# Altium schematic sheet DXES101B-659637-MODEM-PORT.SchDoc
size A3; Organization: Altium Limited; Address1: 3 Minna Close; Address2: Belrose; Address3: NSW 2085; Address4: Australia; SheetNumber: 10; SheetTotal: 10
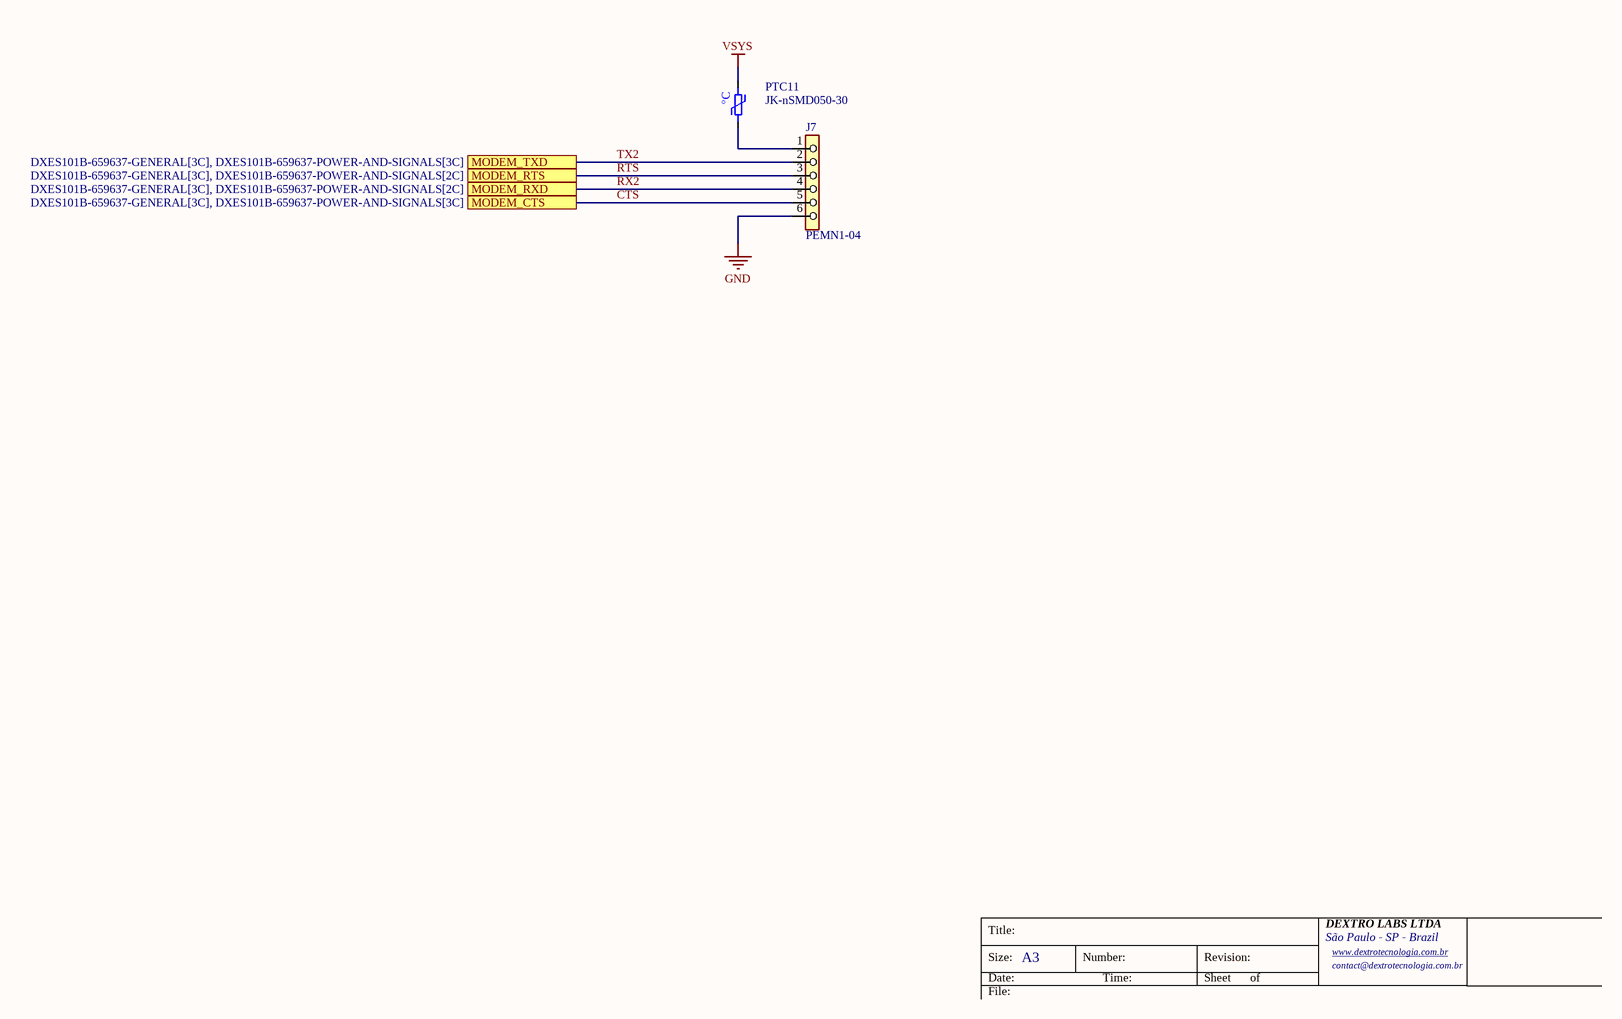
[diagram p0: DXES101B-659637-MODEM-PORT.SchDoc]

## Parts
J7  PEMN1-04  [PEMN1-06]
PTC11  JK-nSMD050-30  [PTC-1206]

## Ports
MODEM_CTS (see DXES101B-659637-GENERAL[3C], DXES101B-659637-POWER-AND-SIGNALS[3C]), MODEM_RTS (see DXES101B-659637-GENERAL[3C], DXES101B-659637-POWER-AND-SIGNALS[2C]), MODEM_RXD (see DXES101B-659637-GENERAL[3C], DXES101B-659637-POWER-AND-SIGNALS[2C]), MODEM_TXD (see DXES101B-659637-GENERAL[3C], DXES101B-659637-POWER-AND-SIGNALS[3C])

## Nets
GND: J7.6
VSYS: PTC11.2
CTS: J7.5 ; port MODEM_CTS
RTS: J7.3 ; port MODEM_RTS
RX2: J7.4 ; port MODEM_RXD
TX2: J7.2 ; port MODEM_TXD
NetJ7_1: J7.1 PTC11.1

## Notes on the sheet
- Title:
- Size:
- Date:
- A3
- Number:
- Time:
- Revision:
- Sheet
- of
- DEXTRO LABS LTDA
- São Paulo - SP - Brazil
- www.dextrotecnologia.com.br <http://www.dextrotecnologia.com.br>
- contact@dextrotecnologia.com.br
- File:
- (in symbol PTC-FUSE-30V-500mA-1206) °C

## Library data of the parts
J7 = PEMN1-06: Conector PTH passo 2,5mm - Montagem em placa - 90º - 250VCA - 3A - 10mOhms
PTC11 = PTC-FUSE-30V-500mA-1206: 30V 500mA 100A 1A 150mΩ 1206 PTC Resettable Fuses ROHS; LCSC: C720075